# EAGLE design MCP73833_QFN_v1.0 (EAGLE 9.6.2)
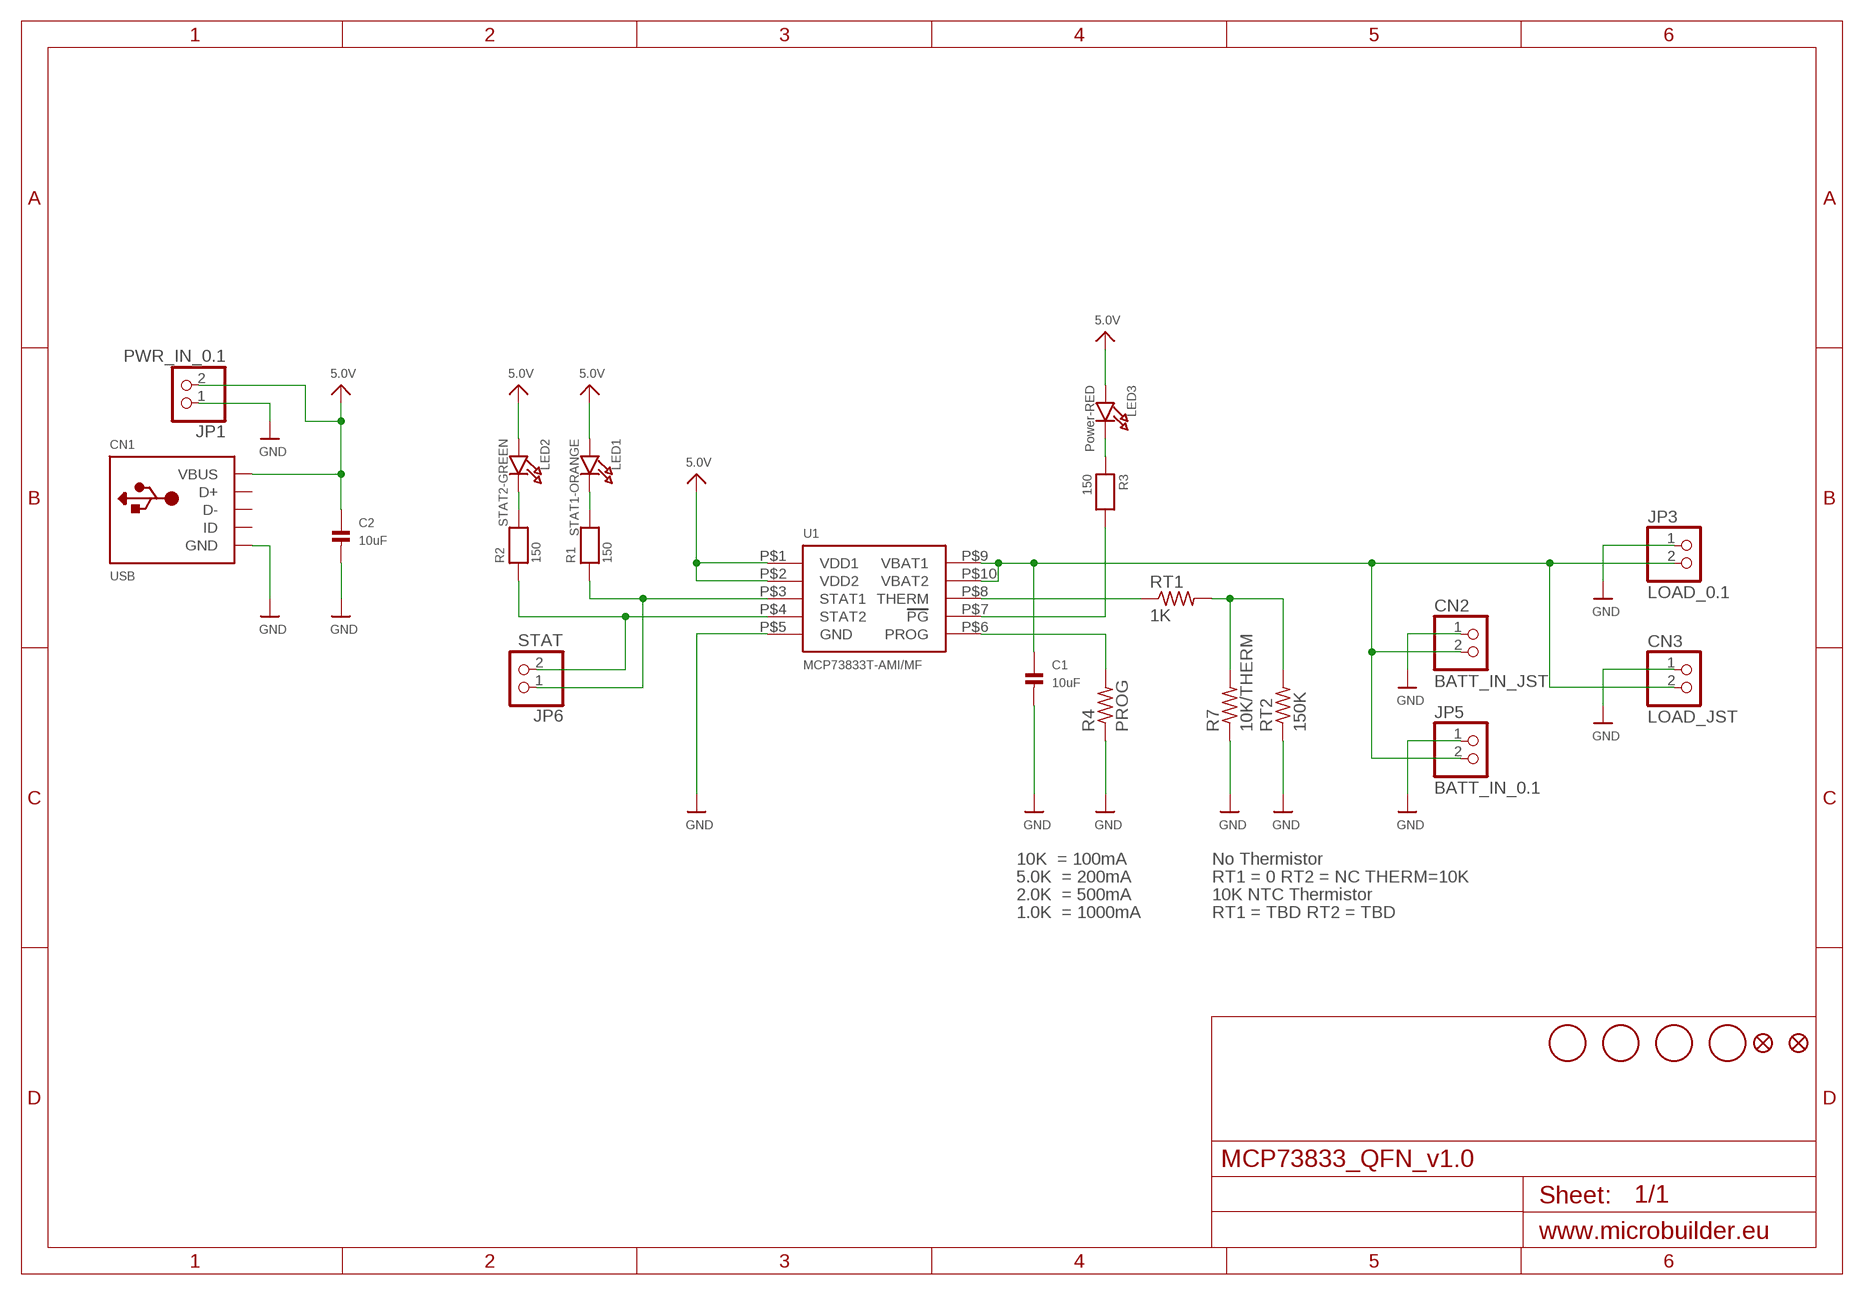
[diagram p0: schematic, sheet 1]

## Parts
C1  10uF  CAP_CERAMIC0805  [0805]
C2  10uF  CAP_CERAMIC0805  [0805]
CN1  USB  USBMINIBLARGE  [USB-MINIB_LARGER]
CN2  BATT_IN_JST  JST_2PIN  [JSTPH2]
CN3  LOAD_JST  JST_2PIN  [JSTPH2]
JP1  PWR_IN_0.1  HEADER-1X2  [1X02_OVAL]
JP2  FIDUCIAL1.5X3  FIDUCIAL1X2.5  [FIDUCIAL-1X2.5]
JP3  LOAD_0.1  HEADER-1X2  [1X02_OVAL]
JP4  FIDUCIAL1.5X3  FIDUCIAL1X2.5  [FIDUCIAL-1X2.5]
JP5  BATT_IN_0.1  HEADER-1X2  [1X02_OVAL]
JP6  STAT  HEADER-1X2  [1X02_OVAL]
LED1  STAT1-ORANGE  LED0805  [CHIPLED_0805]
LED2  STAT2-GREEN  LED0805  [CHIPLED_0805]
LED3  Power-RED  LED0805  [CHIPLED_0805]
R1  150  RESISTOR0805  [0805]
R2  150  RESISTOR0805  [0805]
R3  150  RESISTOR0805  [0805]
R4  PROG  RESISTOR_DUAL  [0805-THM]
R7  10K/THERM  R-US_FLIPFLOP  [0805-THM]
RT1  1K  R-US_R0805  [R0805]
RT2  150K  R-US_R0805  [R0805]
U1  MCP73833T-AMI/MF  MCP73833DFN  [DFN10_3X3MM]
U$11  MOUNTINGHOLE2.0  [MOUNTINGHOLE_2.0_PLATED]
U$16  MOUNTINGHOLE2.0  [MOUNTINGHOLE_2.0_PLATED]
U$18  MOUNTINGHOLE2.0  [MOUNTINGHOLE_2.0_PLATED]
U$19  MOUNTINGHOLE2.0  [MOUNTINGHOLE_2.0_PLATED]

## Nets
5.0V: C2.1 CN1.VBUS JP1.2 LED1.A LED2.A LED3.A U1.P$1(VDD1) U1.P$2(VDD2)
BATT: C1.1 CN2.2 CN3.2 JP3.2 JP5.2 U1.P$9(VBAT1) U1.P$10(VBAT2)
GND: C1.2 C2.2 CN1.GND CN2.1 CN3.1 JP1.1 JP3.1 JP5.1 R4.1 R7.1 RT2.1 U1.P$5(GND)
N$1: LED1.C R1.2
N$2: LED2.C R2.2
N$3: JP6.1 R1.1 U1.P$3(STAT1)
N$4: JP6.2 R2.1 U1.P$4(STAT2)
N$5: RT1.1 U1.P$8(THERM)
N$6: R3.2 U1.P$7(PG)
N$8: R7.2 RT1.2 RT2.2
N$12: LED3.C R3.1
N$16: R4.2 U1.P$6(PROG)
Unconnected: CN1.D+ CN1.D- CN1.ID

## Notes on the sheet
- 10K  = 100mA | No Thermistor
- 5.0K  = 200mA | RT1 = 0 RT2 = NC THERM=10K
- 2.0K  = 500mA | 10K NTC Thermistor
- 1.0K  = 1000mA | RT1 = TBD RT2 = TBD

## Library data of the parts
C1 C2 = microbuilder:CAP_CERAMIC: Ceramic Capacitors 0402 - 0402 Surface Mount Capacitors 16pF 50V 5% [Digikey: 445-4899-2-ND] 18pF 50V 5% [Digikey: 490-1281-2-ND] 22pF 50V 5% [Digikey: 490-1283-2-ND] 68pF 50V 5% [Digikey: 490-1289-2-ND] 0.1uF 10V 10% [Digikey: 490-1318-2-ND] 1.0uF 6.3V 10% [Digikey: 490-1320-2-ND] 0603 - 0603 Surface Mount Capacitors 16 pF 50V 5% [Digikey: 445-5051-2-ND] 22 pF 50V [Digikey: PCC220ACVTR-ND] 33 pF 50V 5% [Digikey: 490-1415-1-ND] 56pF 50V 5% [Digikey: 490-1421-1-ND] 220pF 50V 5% [Digikey: 445-1285-1-ND] 680 pF 50V 2200 pF 50V 5% C0G [Digikey: 445-1297-1-ND] 5600 pF 100V 5% X7R [Digikey: 478-3711-1-ND] 0.1 µF 25V 10% [Digikey: PCC2277TR-ND] 0.22 µF 16V 10% X7R [Digikey: 445-1318-1-ND] 1.0 µF 25V 10% [Digikey: 445-5146-2-ND] 0603 - RF Specific 3pF 250V +/-0.1pF RF [Digikey: 712-1347-1-ND] 18 pF 250V 5% [Digikey: 478-3505-1-ND or 712-1322-1-ND] 56 pF 250V 5% C0G RF [Digikey: 490-4867-1-ND] 68 pF 250V RF [Digikey: 490-4868-1-ND] 0805 - 0805 Surface Mount Capacitors 220 pF 250V 2% RF Ceramic Capacitor [Digikey: 712-1398-1-ND] 1000 pF 50V 2% NP0 Ceramic Capacitor [Digikey: 478-3760-1-ND] 0.1 µF 25V 10% Ceramic Capacitor [Digikey: PCC1828TR-ND] 1.0 µF 16V 10% Ceramic Capacitor[Digikey: 490-1691-2-ND] 10.0 µF 10V 10% Ceramic Capacitor[Digikey: 709-1228-1-ND] 10.0 uF 16V 10% Ceramic Capacitor [Digikey: 478-5165-2-ND] 47 uF 6.3V 20% Ceramic Capacitor [Digikey: 399-5506-1-ND] 1206 - 1206 Surface Mount Capacitors 47uF 10V 20% Ceramic Capacitor [Digikey: 399-5508-1-ND]
CN1 = microbuilder:USB: USB Connectors USBMINIB - Surface Mount Female Mini-B USB Connector 4UConnector: 06564
CN2 CN3 = microbuilder:JST_2PIN: JST 2-Pin Right-Angle Connector PH-Series - 4UConnector: 17311 SH-Series - 4UConnector: 07278
JP1 JP3 JP5 JP6 = microbuilder:HEADER-1X2: PIN HEADER
JP2 JP4 = microbuilder:FIDUCIAL: Fiducial Alignment Points Various fiducial points for machine vision alignment.
LED1-LED3 = microbuilder:LED: LED 0603 - 0603 Surface Mount Package 2mA: Green LED - Low Power (3.9mcd, 2ma, 1.7Vf) - Digikey: 475-2709-2-ND Orange LED - Low Power (9.8mcd, 2ma, 1.8Vf) - Digikey: 475-1194-2-ND Red LED - Low Power (5mcd, 2ma, 1.8Vf) - Digikey: 475-1195-2-ND Yellow LED - Low Power (7mcd, 2ma, 1.8Vf) - Digikey: 475-1196-2-ND 5mA: Blue LED - Low Power (17mcd, 5ma, 2.9Vf) - Digikey: LNJ937W8CRACT-ND 0805 - 0805 Surface Mount Package 2mA: Red LED (8.8mcd, 2mA, 1.8Vf, Clear) - Low Power [Digikey: 475-2510-1-ND] Green LED (5mcd, 2mA, 1.8Vf, Clear) - Low Power [Digikey: 475-2730-1-ND] Yellow LED (11.3mcd, 2mA, 1.8Vf, Clear) - Low Power [Digikey: 475-2555-1-ND] 20mA: Red LED (104mcd, 20mA, Diffused) - LS R976 [Digikey: 475-1278-6-ND] Red LED (12mcd, 20mA, 2.0Vf, Clear) - APT2012EC [Digikey: 754-1128-1-ND] Green LED (15mcd, 20mA, 2.2Vf, Clear) - APT2012GC [Digikey: 754-1131-1-ND] Orange LED (160mcd, 20mA, 2.1Vf, Clear) - APT2012SECK [Digikey: 754-1130-1-ND] 1206 - 1206 Surface Mount Package Green LED (26mcd, 20mA, Diffused) - LG N971 [Digikey: 475-1407-6-ND] Red LED (15mcd, 20mA, Diffused) - LH N974 [Digikey: 475-1416-6-ND]
R1-R3 = microbuilder:RESISTOR: Resistors 0402 - 0402 Surface Mount Package 22 Ohm 1% 1/16W [Digikey: 311-22.0LRTR-ND] 33 Ohm 5% 1/16W 1.0K 5% 1/16W 1.5K 5% 1/16W 2.0K 1% 1/16W 10.0K 1% 1/16W [Digikey: 311-10.0KLRTR-ND] 10.0K 5% 1/16W [Digikey: RMCF0402JT10K0TR-ND] 12.1K 1% 1/16W [Digikey: 311-22.0LRTR-ND] 100.0K 5% 1/16W 0603 - 0603 Surface Mount Package 0 Ohm 1/10 Watt 1% Resistor 15 Ohm 1/10 Watt 1% Resistor 33 Ohm 1/10 Watt 1% Resistor 49.9 Ohm 1/10 Watt 1% Resistor 100 Ohm 1/10 Watt 1% Resistor 150 Ohm 1/10 Watt 1% Resistor 240 Ohm 1/10 Watt 1% Resistor 390 Ohm 1/10 Watt 1% Resistor 560 Ohm 1/10 Watt 1% Resistor 680 Ohm 1/10 Watt 1% Resistor 750 Ohm 1/10 Watt 1% Resistor 1.0K Ohm 1/10 Watt 1% Resistor 1.5K Ohm 1/10 Watt 1% Resistor 2.0K Ohm 1/10 Watt 1% Resistor 2.2K Ohm 1/10 Watt 1% Resistor 3.3K Ohm 1/10 Watt 1% Resistor 4.7K Ohm 1/10 Watt 1% Resistor 10.0K Ohm 1/10 Watt 1% Resistor 12.0K Ohm 1/10 Watt 1% Resistor 12.1K Ohm 1/10 Watt 1% Resistor 20.0K Ohm 1/10 Watt 1% Resistor 33.0K Ohm 1/10 Watt 1% Resistor 100.0K Ohm 1/10 Watt 1% Resistor 0805 - 0805 Surface Mount Package 0 Ohm 1/8 Watt 1% Resistor 33 Ohm 1/8 Watt 1% Resistor 100 Ohm 1/8 Watt 1% Resistor 150 Ohm 1/8 Watt 1% Resistor 200 Ohm 1/8 Watt 1% Resistor 240 Ohm 1/8 Watt 1% Resistor 330 Ohm 1/8 Watt 1% Resistor 390 Ohm 1/8 Watt 1% Resistor 470 Ohm 1/8 Watt 1% Resistor 1.0K Ohm 1/8 Watt 1% Resistor 1.5K Ohm 1/8 Watt 1% Resistor 2.0K Ohm 1/8 Watt 1% Resistor 4.7K Ohm 1/8 Watt 1% Resistor 5.1K Ohm 1/8 Watt 1% Resistor 5.6K Ohm 1/8 Watt 1% Resistor 10.0K Ohm 1/8 Watt 1% Resistor 22.0K Ohm 1/8 Watt 1% Resistor 33.0K Ohm 1/8 Watt 1% Resistor 100K Ohm 1/8 Watt 1% Resistor 1206 - 1206 Surface Mount Package
R4 = microbuilder:RESISTOR_DUAL: Flip Flop resistor An 0805 resistor inside a standard 1/4W 5% resistor. Makes for easy mods Footprint taken from the Adafruit Industries Eagle Library.
R7 RT1 RT2 = adafruit:R-US_: RESISTOR, American symbol
U1 = microbuilder:MCP73833: Lithium-Polymer/Lithium-Ion Battery Charger [Part No.] Microchip MCP73833 MSOP10 (tube only): Digikey: MCP73833T-AMI/UN or MCP73833-FCI/UN-ND Mouser: 579-MCP73833-AMI/UN DFN10 (tape): Digikey: Note Chips ending in 'AMI' have no timer, and chips ending in 'FCI' have a 6-hour timer that will end the charge sequence after 6 horus regqrdless of current charge level.
U$11 U$16 U$18 U$19 = microbuilder:MOUNTINGHOLE: Mounting Hole

## Board
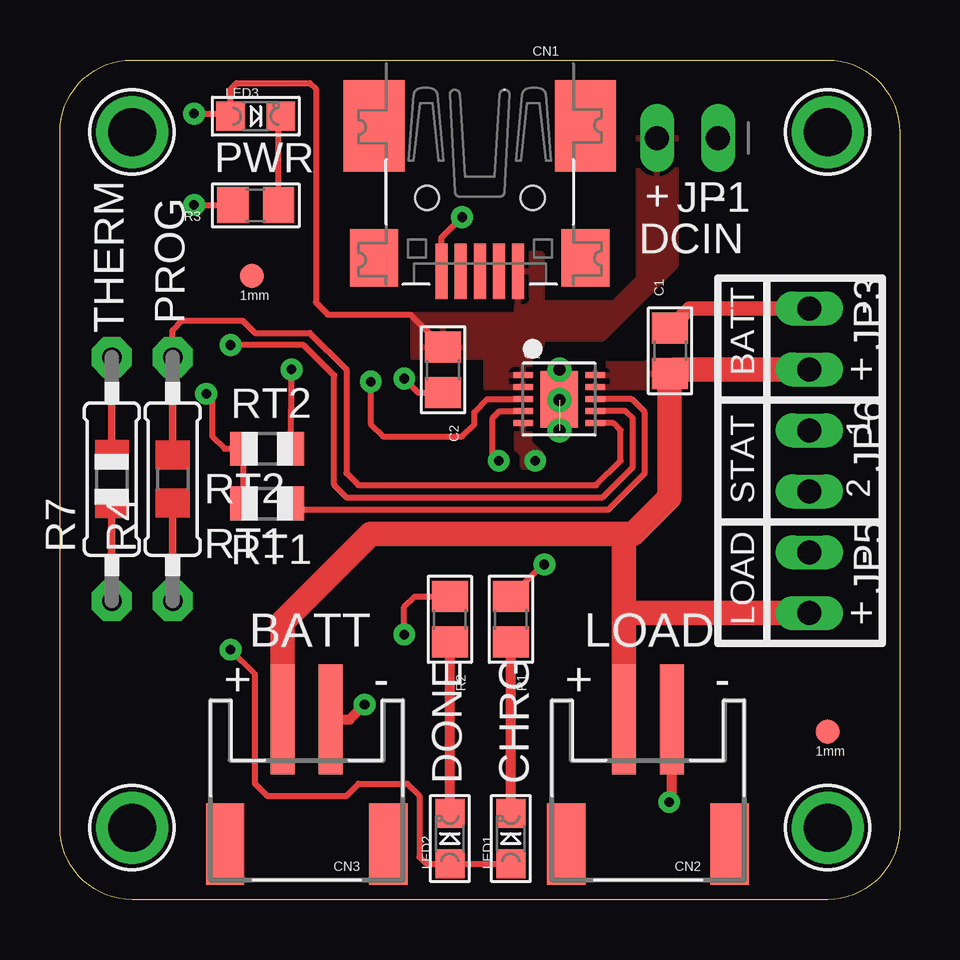
[diagram p1: board, top side]
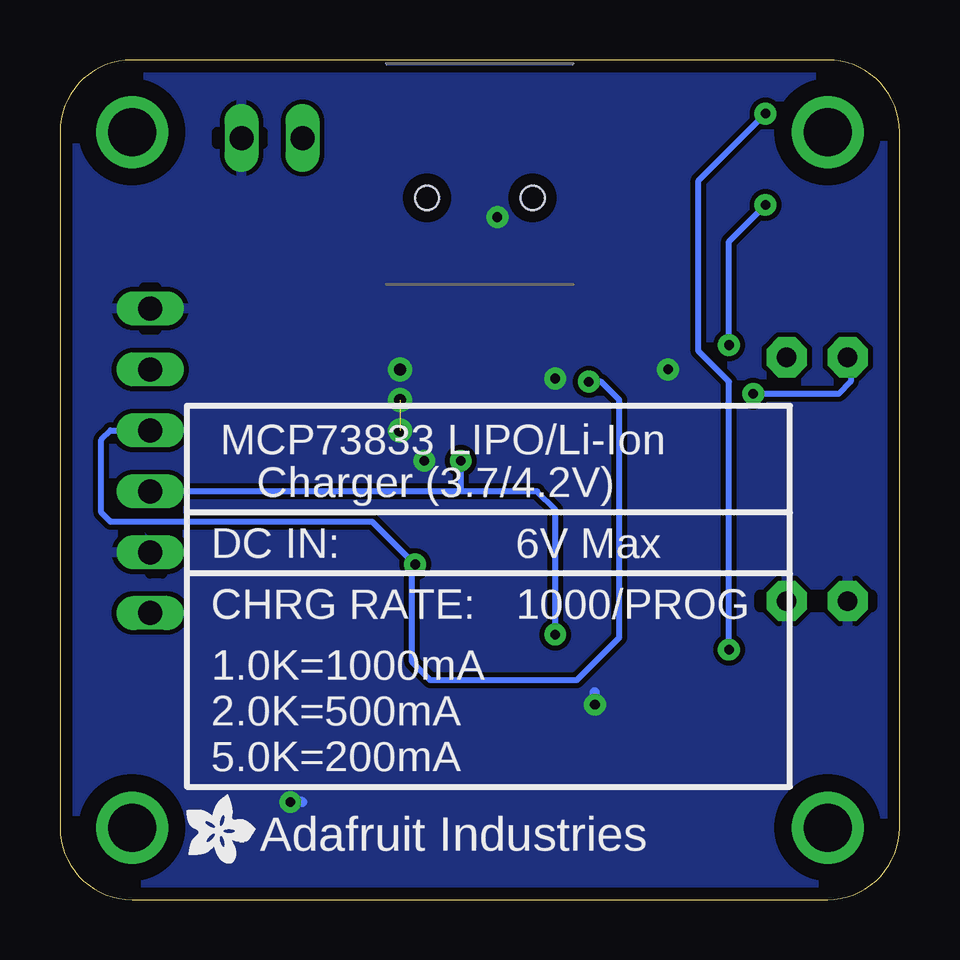
[diagram p2: board, bottom side, seen from below]

Size 35 x 35 mm. Coordinates in mm from the lower left corner, seen from the top.
Outline: 0,3 0,32 arc-90 3,35 32,35 arc-90 35,32 35,3 arc-90 32,0 3,0 arc-90 0,3
Copper layers (1*16): Top 0.035mm / dielectric 1.5mm / Bottom 0.035mm
Design rules "PCBCart-Standard": minimum track width 8mil, minimum drill 0.4mm, track to track 8mil, track to pad 8mil, pad to pad 8mil, via to via 8mil, smd to smd 8mil, copper to edge 20mil, drill to drill 8mil, minimum pad ring 8mil, minimum via ring 10mil, stop-mask expansion 3mil, vias tented up to drill 20mil, thermal gap 8mil
tRestrict: area 19.1,21.6 to 19.6,21.7; area 22.1,21.6 to 22.6,21.7; area 22.1,22.1 to 22.7,22.4
bRestrict: area 26.5,31.5 to 26.7,32; area 30.7,13.6 to 31.2,13.7; area 30.7,15.4 to 31.2,15.5; area 31,23.7 to 31.5,23.9; area 31,25.4 to 31.5,25.5; area 28.3,31.5 to 28.4,32; area 3.2,12.2 to 3.3,12.7; area 1.1,12.2 to 1.3,12.7; area 5.7,12.2 to 5.8,12.7; area 3.7,12.2 to 3.8,12.7

### Footprints (pad centres in the part's own frame; a part is rotated, then mirrored left to right if it is on the bottom)
0805 = smd 1.3 x 1.5: 1 -0.95,0; 2 0.95,0
USB-MINIB_LARGER = smd 0.5 x 2.308: D+ 0,4.064; D- -0.8,4.064; GND 1.6,4.064; ID 0.8,4.064; VBUS -1.6,4.064 | smd 2.54 x 3.81: GND1 -4.4,-2; GND4 4.4,-2 | smd 2 x 2.4: GND2 -4.4,3.5; GND3 4.4,3.5 | hole 1: -2.2,1; 2.2,1
JSTPH2 = smd 1 x 4.6: 1 -1,-3.7; 2 1,-3.7 | smd 1.6 x 3.4: NC1 -3.4,1.5; NC2 3.4,1.5
1X02_OVAL = drill 1 long: 1 -1.27,0; 2 1.27,0
FIDUCIAL-1X2.5 = smd 1 x 1: 1 0,0
CHIPLED_0805 = smd 1.2 x 1.2: A 0,-1.05; C 0,1.05
0805-THM = drill 0.813 pad 1.676 octagon: 1 -5.08,0; 2 5.08,0
R0805 = smd 1.1 x 1.4: 1 -1,0; 2 1,0
DFN10_3X3MM = smd 2.35 x 1.58: GND 0,0 | smd 0.25 x 0.8: P$1 -1,-1.5; P$2 -0.5,-1.5; P$3 0,-1.5; P$4 0.5,-1.5; P$5 1,-1.5; P$6 1,1.5; P$7 0.5,1.5; P$8 0,1.5; P$9 -0.5,1.5; P$10 -1,1.5
MOUNTINGHOLE_2.0_PLATED = drill 2 pad 3: P$1 0,0

### Placement (x,y rotation side)
C1  25.43,22.88 90 top
C2  15.97,22.08 270 top
CN1  17.5,30.25 180 top
CN2  24.51,3.81 180 top
CN3  10.29,3.81 180 top
JP1  26.16,31.75 180 top
JP2  8,26 0 top
JP3  31.24,23.37 270 top
JP4  32,7 0 top
JP5  31.24,13.21 270 top
JP6  31.24,18.29 270 top
LED1  18.8,2.54 0 top
LED2  16.26,2.54 0 top
LED3  8.16,32.66 270 top
R1  18.8,11.68 270 top
R2  16.26,11.68 270 top
R3  8.16,28.94 180 top
R4  4.7,17.53 90 top
R7  2.16,17.53 90 top
RT1  8.64,16.51 180 top
RT2  8.64,18.8 180 top
U1  20.81,20.86 270 top
U$11  32,3 0 top
U$14  [ADAFRUIT200MIL]  28.32,3.05 270 bottom
U$16  32,32 0 top
U$18  3,32 0 top
U$19  3,3 0 top

### Tracks (layer width: path | path; a pad name or v marks a point on that pad's centre or on a via)
5.0V  (via drill 0.4)
  Top 0.254: 15.89,23.11 C2.1 14.62,24.38 11.18,24.38 10.67,24.89 10.67,33.78 10.41,34.04 7.37,34.04 7.11,33.78 LED3.A 7,32.77 v5.59,32.77 | v7.11,10.41 8.13,9.4 8.13,4.83 8.64,4.32 11.94,4.32 12.45,4.83 14.48,4.83 14.99,4.32 14.99,1.78 15.27,1.49 LED2.A LED1.A
  Bottom 0.254: v7.11,10.41 7.11,21.59 8.38,22.86 8.38,29.97 v5.59,32.77
  pour Top: 19.05,26.92 20.07,26.92 20.07,23.11 19.56,23.11 19.56,21.34 17.78,21.34 17.78,22.35 17.78,22.61 14.73,22.61 14.73,24.38 19.05,24.38
  pour Top: 24.13,32.51 25.65,32.51 25.65,26.42 22.61,23.37 19.81,23.37 19.81,24.89 23.11,24.89 24.13,25.91
BATT
  Top 1.016: CN3.2 9.29,11.57 12.95,15.24 23.11,15.24 | 23.11,15.24 23.88,15.24 25.4,16.76 25.4,21.89 C1.1 25.6,22.1 JP3.2 | 23.51,11.94 23.51,15.1 23.11,15.24 | 23.51,11.94 CN2.2 | 23.51,11.94 JP5.2
  pour Top: 22.35,21.34 22.35,22.35 25.65,22.35 25.65,21.34
GND  (via drill 0.4, 0.5)  (1 unrouted)
  Top 0.254: CN1.GND 15.9,27.58 v16.76,28.45 | C2.2 14.94,21.13 v14.35,21.72 | RT2.1 v9.65,22.1
  Top 0.406: CN3.1 12.08,7.51 v12.7,8.13 | CN2.1 25.51,4.17 v25.4,4.06
  Top 0.61: JP3.1 26.24,24.64 C1.2
  Bottom 0.254: v16.76,28.45 17.02,28.45 | v19.81,18.29 20.07,18.29
  Bottom 0.406: v12.7,8.13 12.7,8.64 | 24.89,4.06 v25.4,4.06
  other vias: 20.83,22.1 20.83,20.83 20.83,19.56
  pour Bottom (isolate 0.203): 0,35 35,35 35,0 0,0
  pour Top: 19.05,19.81 19.56,19.81 19.56,19.05 20.07,18.54 20.07,18.03 19.3,18.03 19.3,18.54 19.05,18.8
N$1
  Top 0.406: LED1.C R1.2
N$2
  Top 0.406: LED2.C R2.2
N$3  (via drill 0.4)
  Top 0.254: v20.19,13.97 20.13,13.97 R1.1 | U1.P$3 17.81,20.86 17.27,20.32 17.27,19.81 16.76,19.3 13.46,19.3 12.95,19.81 v12.95,21.59
  Bottom 0.254: JP6.1 32.89,19.56 33.27,19.18 33.27,16.13 32.89,15.75 21.97,15.75 v20.19,13.97 20.32,13.84 20.32,9.91 19.56,9.14 13.46,9.14 11.68,10.92 11.68,20.83 12.45,21.59 v12.95,21.59
N$4  (via drill 0.4)
  Top 0.254: R2.1 14.79,12.63 14.35,12.19 v14.35,11.05 | U1.P$4 18.33,20.36 18.03,20.07 18.03,18.54 v18.29,18.29
  Bottom 0.254: 18.29,17.02 15.11,17.02 14.35,16.26 v14.35,11.05 | 18.29,17.02 JP6.2 | 18.29,17.02 v18.29,18.29
N$5
  Top 0.254: U1.P$8 23.84,20.86 24.38,20.32 24.38,17.78 22.86,16.26 9.89,16.26 RT1.1
N$6  (via drill 0.4)
  Top 0.254: U1.P$7 23.58,20.36 23.88,20.07 23.88,18.03 22.61,16.76 11.94,16.76 11.43,17.27 11.43,21.84 10.16,23.11 v7.11,23.11 | v5.59,28.96 7.19,28.96 R3.2
  Bottom 0.254: v7.11,23.11 7.11,27.43 v5.59,28.96
N$8  (via drill 0.4)
  Top 0.254: RT1.2 RT2.2 6.86,18.8 6.35,19.3 6.35,20.83 v6.1,21.08
  Bottom 0.254: v6.1,21.08 2.54,21.08 2.03,21.59 2.03,22.48 R7.2
N$12
  Top 0.254: R3.1 9.11,32.55 LED3.C
N$16
  Top 0.254: R4.2 4.7,23.75 5.08,24.13 7.62,24.13 8.13,23.62 10.41,23.62 11.94,22.1 11.94,17.78 12.45,17.27 22.35,17.27 23.37,18.29 23.37,19.56 23.07,19.86 U1.P$6

### Text on the board
tPlace: PWR | + | - | DCIN | THERM | PROG | - | BATT | + | RT2 | 1 | STAT | 2 | RT1 | - | BATT | LOAD | LOAD | + | DONE | CHRG
bPlace: MCP73833 LIPO/Li-Ion | Charger (3.7/4.2V) | 6V Max | DC IN: | 1000/PROG | CHRG RATE: | 1.0K=1000mA | 2.0K=500mA | 5.0K=200mA | Adafruit Industries